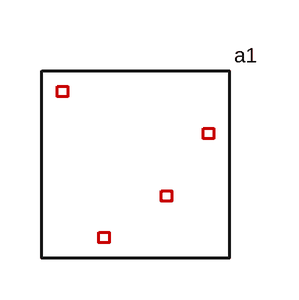
[diagram p0: schematic adevice_prefix_lower_case.asc]
adevice_prefix_lower_case.asc, the LTspice schematic file:
Version 4
SHEET 1 880 680
SYMBOL cell4 320 64 R0
SYMATTR InstName a1
SYMATTR Prefix a
SYMATTR Value AND

The netlist it stands for:
* adevice_prefix_lower_case.asc
a1 0 0 0 0 0 0 0 0 AND
.backanno
.end